# Altium schematic sheet Sketch sheet.SchDoc
size A4
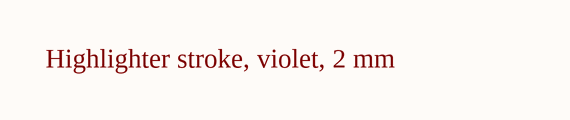
[diagram p0: Sketch sheet.SchDoc]

## Notes on the sheet
- Highlighter stroke, violet, 2 mm